# Altium project rect_and_enc.PrjPCB
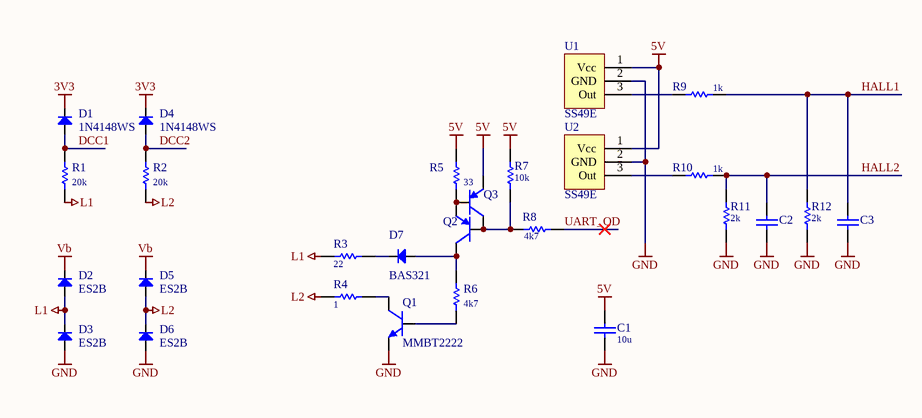
[diagram p0: board.SchDoc]
PRJ_VER: v1.0.0; PRJ_ID: Rectifier
1 sheet, 27 parts. Net scope: global (net labels, ports and power ports of the same name join across sheets).
Board file: board.PcbDoc

## Sheet board.SchDoc: Display & buttons board
size A4; Revision: 1; SheetNumber: 6; SheetTotal: 29

### Parts
C1  10u  [C1210-2.5MM]
C2  100pF  [C0402]  (value not drawn)
C3  100pF  [C0402]  (value not drawn)
D1  1N4148WS  [SOD-323]
D2  ES2B  [SMB]
D3  ES2B  [SMB]
D4  1N4148WS  [SOD-323]
D5  ES2B  [SMB]
D6  ES2B  [SMB]
D7  BAS321  [SOD-323]
Q1  MMBT2222  [SOT-23]
Q2  Bipolar PNP 3 Pins Transistor Gummel-Poon Model  [SOT-23]  (value not drawn)
Q3  Bipolar PNP 3 Pins Transistor Gummel-Poon Model  [SOT-23]  (value not drawn)
R1  20k  [R0603]
R2  20k  [R0603]
R3  22  [R0805]
R4  1  [R0603]
R5  33  [R0603]
R6  4k7  [R0603]
R7  10k  [R1206]
R8  4k7  [R0603]
R9  1k  [R0402]
R10  1k  [R0402]
R11  2k  [R0402]
R12  2k  [R0402]
U1  SS49E  [SS49E]
U2  SS49E  [SS49E]

### Nets
3V3: D1.2(+) D4.2(+)
5V: C1.1 Q3.2(E) R5.1 R7.2 U1.1(Vcc) U2.1(Vcc)
GND: C1.2 C2.2 C3.2 D3.1(-) D6.1(-) Q1.2(E) R11.1 R12.1 U1.2(GND) U2.2(GND)
L1: D2.1(-) D3.2(+) R1.2 R3.1
L2: D5.1(-) D6.2(+) R2.2 R4.1
Vb: D2.2(+) D5.2(+)
DCC1: D1.1(-) R1.1
DCC2: D4.1(-) R2.1
HALL1: C3.1 R9.2 R12.2
HALL2: C2.1 R10.2 R11.2
UART_OD: R8.2
NetD7_1: D7.1(-) Q2.3(C) R6.1
NetD7_2: D7.2(+) R3.2
NetQ1_1: Q1.1(B) R6.2
NetQ1_3: Q1.3(C) R4.2
NetQ2_1: Q2.1(B) Q3.3(C) R7.1 R8.1
NetQ2_2: Q2.2(E) Q3.1(B) R5.2
NetR9_1: R9.1 U1.3(Out)
NetR10_1: R10.1 U2.3(Out)

### Library data of the parts
C1-C3 = CAP
D1-D7 = NCP51460SN33T1G
Q1 = MMBT2222ALT1G
Q2 Q3 = BJT PNP GP
R1-R12 = RES